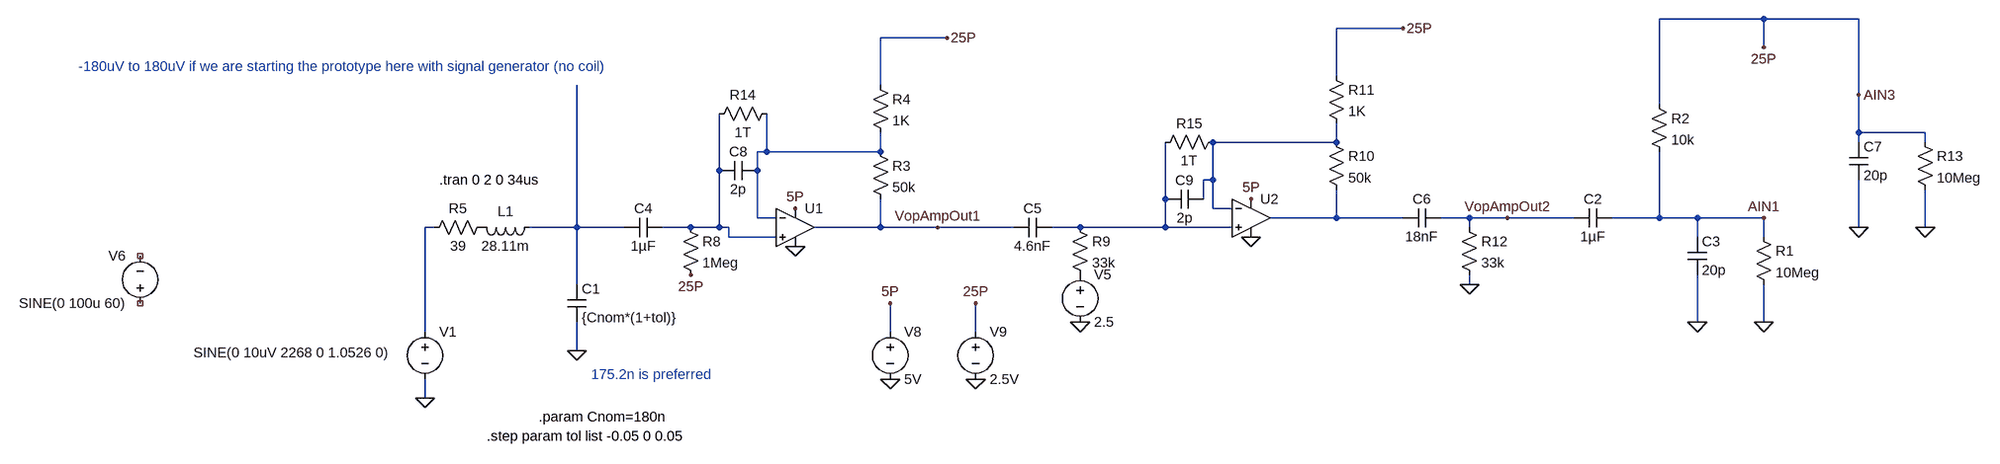
[diagram p0: schematic AmplificationSim.asc]
AmplificationSim.asc, the LTspice schematic file:
Version 4.1
SHEET 1 2180 836
WIRE 1808 -288 1632 -288
WIRE 1968 -288 1808 -288
WIRE 1200 -272 1088 -272
WIRE 432 -256 320 -256
WIRE 1808 -240 1808 -288
WIRE 1088 -192 1088 -272
WIRE 320 -176 320 -256
WIRE 1968 -160 1968 -288
WIRE 1632 -144 1632 -288
WIRE 1968 -96 1968 -160
WIRE 2080 -96 1968 -96
WIRE 1088 -80 1088 -112
WIRE 1088 -80 880 -80
WIRE 1968 -80 1968 -96
WIRE 2080 -80 2080 -96
WIRE 128 -64 128 -128
WIRE 128 -64 112 -64
WIRE 320 -64 320 -96
WIRE 320 -64 128 -64
WIRE 48 -32 48 -128
WIRE 112 -32 112 -64
WIRE 880 -16 880 -80
WIRE 880 -16 864 -16
WIRE 800 16 800 -80
WIRE 864 16 864 -16
WIRE 880 32 880 -16
WIRE 912 32 880 32
WIRE 112 48 112 -32
WIRE 144 48 112 48
WIRE 1088 48 1088 0
WIRE 1088 48 976 48
WIRE 1200 48 1088 48
WIRE 1312 48 1264 48
WIRE 1376 48 1312 48
WIRE 1488 48 1376 48
WIRE 1632 48 1632 -64
WIRE 1632 48 1552 48
WIRE 1696 48 1632 48
WIRE 1808 48 1696 48
WIRE -432 64 -448 64
WIRE -192 64 -192 -176
WIRE -192 64 -272 64
WIRE -112 64 -192 64
WIRE 0 64 -48 64
WIRE 48 64 48 -32
WIRE 48 64 0 64
WIRE 64 64 48 64
WIRE 320 64 320 16
WIRE 320 64 208 64
WIRE 416 64 320 64
WIRE 544 64 416 64
WIRE 656 64 608 64
WIRE 800 64 800 16
WIRE 800 64 656 64
WIRE 912 64 800 64
WIRE 1312 64 1312 48
WIRE 1968 64 1968 -16
WIRE 2080 64 2080 0
WIRE 64 80 64 64
WIRE 144 80 64 80
WIRE 1696 80 1696 48
WIRE 1808 80 1808 48
WIRE -192 160 -192 64
WIRE 1312 160 1312 144
WIRE 1696 224 1696 144
WIRE 1808 224 1808 160
WIRE -448 240 -448 64
WIRE 336 240 336 192
WIRE 480 240 480 192
WIRE -192 272 -192 224
WIRE -448 352 -448 320
FLAG 1696 224 0
FLAG 1808 224 0
FLAG 1808 48 AIN1
FLAG 176 32 5P
FLAG 416 64 VopAmpOut1
FLAG 176 96 0
FLAG 944 16 5P
FLAG 1376 48 VopAmpOut2
FLAG 944 80 0
FLAG 1312 160 0
FLAG 1968 64 0
FLAG 2080 64 0
FLAG 1968 -160 AIN3
FLAG -448 352 0
FLAG -192 272 0
FLAG 656 224 0
FLAG 336 320 0
FLAG 336 192 5P
FLAG 480 320 0
FLAG 480 192 25P
FLAG 0 144 25P
FLAG 432 -256 25P
FLAG 1200 -272 25P
FLAG 1808 -240 25P
SYMBOL voltage -448 224 R0
WINDOW 3 -390 51 Left 2
WINDOW 123 0 0 Left 0
WINDOW 39 0 0 Left 0
SYMATTR Value SINE(0 10uV 2268 0 1.0526 0)
SYMATTR InstName V1
SYMBOL ind -256 48 R90
WINDOW 0 5 56 VBottom 2
WINDOW 3 32 56 VTop 2
SYMATTR InstName L1
SYMATTR Value 28.11m
SYMATTR SpiceLine Rser=1m
SYMBOL cap -208 160 R0
SYMATTR InstName C1
SYMATTR Value {Cnom*(1+tol)}
SYMBOL cap 1552 32 R90
WINDOW 0 0 32 VBottom 2
WINDOW 3 32 32 VTop 2
SYMATTR InstName C2
SYMATTR Value 1µF
SYMBOL res 1792 64 R0
SYMATTR InstName R1
SYMATTR Value 10Meg
SYMBOL cap 1680 80 R0
SYMATTR InstName C3
SYMATTR Value 20p
SYMBOL res 1616 -160 R0
SYMATTR InstName R2
SYMATTR Value 10k
SYMBOL res 304 -80 R0
SYMATTR InstName R3
SYMATTR Value 50k
SYMBOL res 304 -192 R0
SYMATTR InstName R4
SYMATTR Value 1K
SYMBOL OpAmps\\UniversalOpAmp2 176 64 R0
SYMATTR InstName U1
SYMATTR Value2 Avol=316k GBW=3Meg Slew=2.4Meg
SYMATTR SpiceLine Ilimit=7m Rail=0.1 Vos=0.5m
SYMATTR SpiceLine2 En=2.7n Enk=240 In=0.6f Ink=0 Rin=1e15
SYMBOL res -336 48 R90
WINDOW 0 0 56 VBottom 2
WINDOW 3 32 56 VTop 2
SYMATTR InstName R5
SYMATTR Value 39
SYMBOL voltage -928 208 R180
WINDOW 0 24 96 Left 2
WINDOW 3 24 16 Left 2
SYMATTR InstName V6
SYMATTR Value SINE(0 100u 60)
SYMBOL cap -48 48 R90
WINDOW 0 0 32 VBottom 2
WINDOW 3 32 32 VTop 2
SYMATTR InstName C4
SYMATTR Value 1µF
SYMBOL res -16 48 R0
SYMATTR InstName R8
SYMATTR Value 1Meg
SYMBOL cap 608 48 R90
WINDOW 0 0 32 VBottom 2
WINDOW 3 32 32 VTop 2
SYMATTR InstName C5
SYMATTR Value 4.6nF
SYMBOL res 640 48 R0
SYMATTR InstName R9
SYMATTR Value 33k
SYMBOL res 1072 -96 R0
SYMATTR InstName R10
SYMATTR Value 50k
SYMBOL res 1072 -208 R0
SYMATTR InstName R11
SYMATTR Value 1K
SYMBOL cap 1264 32 R90
WINDOW 0 0 32 VBottom 2
WINDOW 3 32 32 VTop 2
SYMATTR InstName C6
SYMATTR Value 18nF
SYMBOL res 1296 48 R0
SYMATTR InstName R12
SYMATTR Value 33k
SYMBOL res 2064 -96 R0
SYMATTR InstName R13
SYMATTR Value 10Meg
SYMBOL cap 1952 -80 R0
SYMATTR InstName C7
SYMATTR Value 20p
SYMBOL cap 112 -48 R90
WINDOW 0 0 32 VBottom 2
WINDOW 3 32 32 VTop 2
SYMATTR InstName C8
SYMATTR Value 2p
SYMBOL res 144 -144 R90
WINDOW 0 0 56 VBottom 2
WINDOW 3 32 56 VTop 2
SYMATTR InstName R14
SYMATTR Value 1T
SYMBOL cap 864 0 R90
WINDOW 0 0 32 VBottom 2
WINDOW 3 32 32 VTop 2
SYMATTR InstName C9
SYMATTR Value 2p
SYMBOL res 896 -96 R90
WINDOW 0 0 56 VBottom 2
WINDOW 3 32 56 VTop 2
SYMATTR InstName R15
SYMATTR Value 1T
SYMBOL voltage 656 128 R0
WINDOW 123 0 0 Left 0
WINDOW 39 0 0 Left 0
SYMATTR InstName V5
SYMATTR Value 2.5
SYMBOL voltage 336 224 R0
WINDOW 123 0 0 Left 0
WINDOW 39 0 0 Left 0
SYMATTR InstName V8
SYMATTR Value 5V
SYMBOL voltage 480 224 R0
WINDOW 123 0 0 Left 0
WINDOW 39 0 0 Left 0
SYMATTR InstName V9
SYMATTR Value 2.5V
SYMBOL OpAmps\\UniversalOpAmp2 944 48 R0
SYMATTR InstName U2
SYMATTR Value2 Avol=316k GBW=3Meg Slew=2.4Meg
SYMATTR SpiceLine Ilimit=7m Rail=0.1 Vos=0.5m
SYMATTR SpiceLine2 En=2.7n Enk=240 In=0.6f Ink=0 Rin=1e15
TEXT -424 -16 Left 2 !.tran 0 2 0 34us
TEXT -168 312 Left 2 ;175.2n is preferred
TEXT -256 384 Left 2 !.param Cnom=180n
TEXT -344 416 Left 2 !.step param tol list -0.05 0 0.05
TEXT -1032 -208 Left 2 ;-180uV to 180uV if we are starting the prototype here with signal generator (no coil)

The netlist it stands for:
* AmplificationSim.asc
V1 N006 0 SINE(0 10uV 2268 0 1.0526 0)
L1 N007 P001 28.11m Rser=1m
C1 N007 0 {Cnom*(1+tol)}
C2 AIN1 VopAmpOut2 1µF
R1 AIN1 0 10Meg
C3 AIN1 0 20p
R2 25P AIN1 10k
R3 N002 VopAmpOut1 50k
R4 25P N002 1K
X§U1 N003 N002 5P 0 VopAmpOut1 level2 Avol=316k GBW=3Meg Slew=2.4Meg Ilimit=7m Rail=0.1 Vos=0.5m En=2.7n Enk=240 In=0.6f Ink=0 Rin=1e15  ; pins In+ In- V+ V- OUT
R5 P001 N006 39
V6 NC_01 NC_02 SINE(0 100u 60)
C4 N003 N007 1µF
R8 N003 25P 1Meg
C5 N004 VopAmpOut1 4.6nF
R9 N004 P002 33k
R10 N001 N005 50k
R11 25P N001 1K
C6 VopAmpOut2 N005 18nF
R12 VopAmpOut2 0 33k
R13 25P 0 10Meg
C7 25P 0 20p
C8 N002 N003 2p
R14 N002 N003 1T
C9 N001 N004 2p
R15 N001 N004 1T
V5 P002 0 2.5
V8 5P 0 5V
V9 25P 0 2.5V
X§U2 N004 N001 5P 0 N005 level2 Avol=316k GBW=3Meg Slew=2.4Meg Ilimit=7m Rail=0.1 Vos=0.5m En=2.7n Enk=240 In=0.6f Ink=0 Rin=1e15  ; pins In+ In- V+ V- OUT
.tran 0 2 0 34us
* 175.2n is preferred
.param Cnom=180n
.step param tol list -0.05 0 0.05
* -180uV to 180uV if we are starting the prototype here with signal generator (no coil)
.lib UniversalOpAmp2.lib
.backanno
.end